# EAGLE schematic mainboard_test (EAGLE 9.6.2)
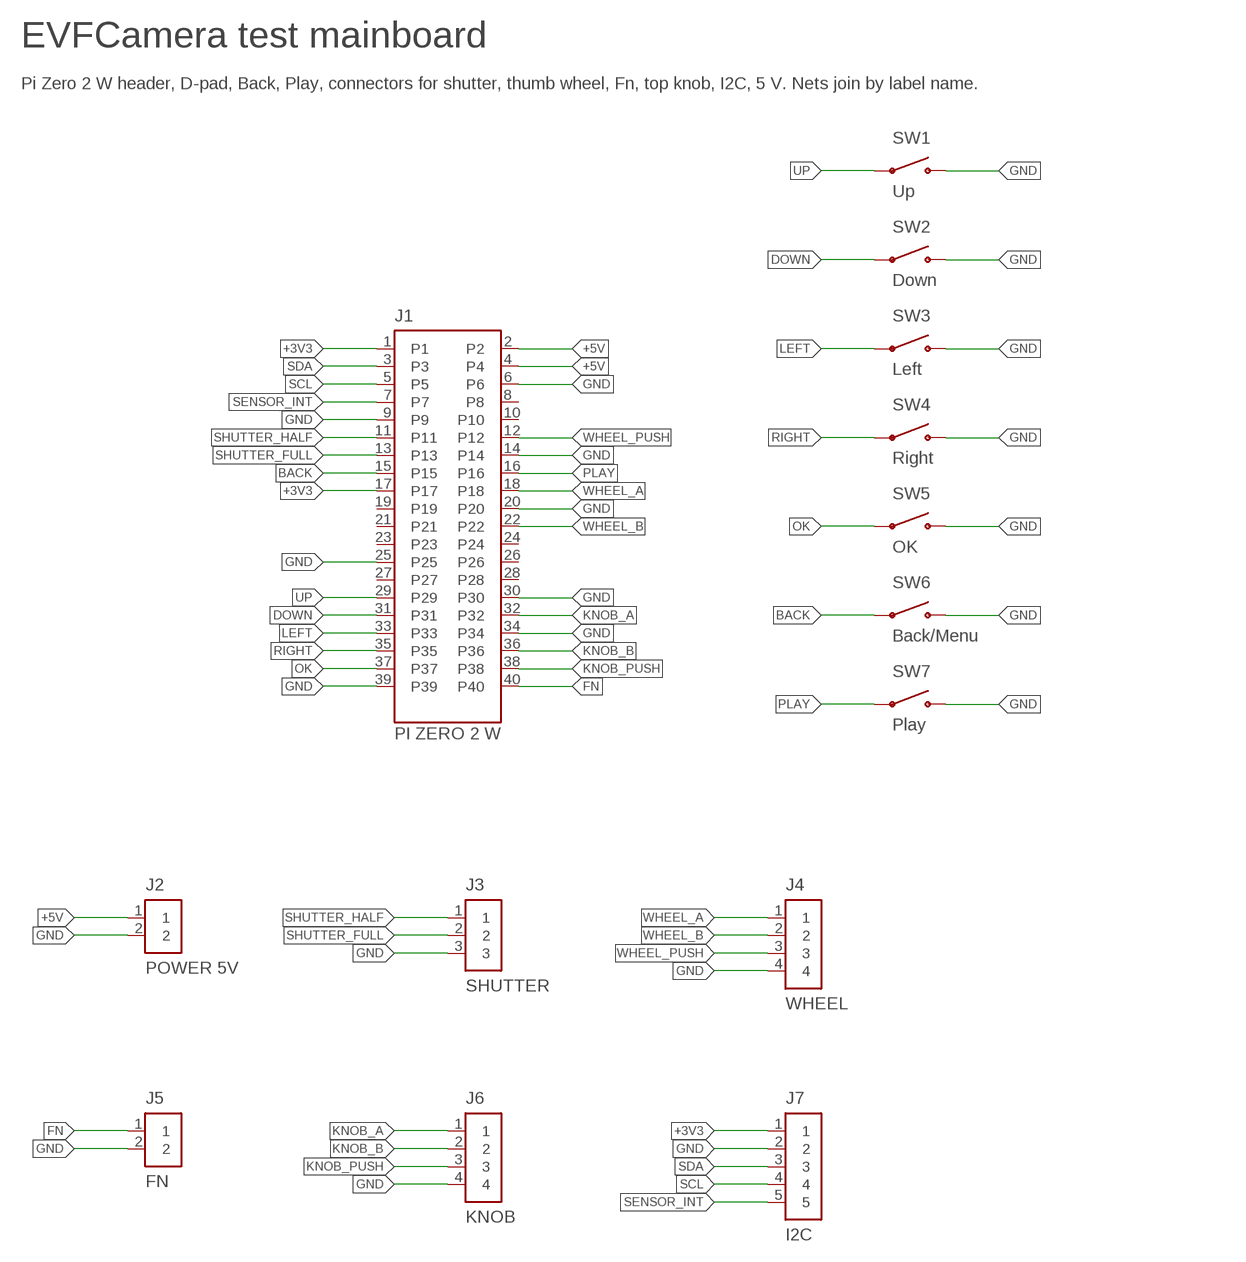
[diagram p0: schematic, sheet 1]

## Parts
J1  PI ZERO 2 W  PI_HEADER  [PI_HEADER_2X20]
J2  POWER 5V  HEADER_1X2  [HEADER_1X2]
J3  SHUTTER  HEADER_1X3  [HEADER_1X3]
J4  WHEEL  HEADER_1X4  [HEADER_1X4]
J5  FN  HEADER_1X2  [HEADER_1X2]
J6  KNOB  HEADER_1X4  [HEADER_1X4]
J7  I2C  HEADER_1X5  [HEADER_1X5]
SW1  Up  TACT_6X6  [TACT_6X6_THT]
SW2  Down  TACT_6X6  [TACT_6X6_THT]
SW3  Left  TACT_6X6  [TACT_6X6_THT]
SW4  Right  TACT_6X6  [TACT_6X6_THT]
SW5  OK  TACT_6X6  [TACT_6X6_THT]
SW6  Back/Menu  TACT_6X6  [TACT_6X6_THT]
SW7  Play  TACT_6X6  [TACT_6X6_THT]

## Nets
+3V3: J1.1 J1.17 J7.1
+5V: J1.2 J1.4 J2.1
BACK: J1.15 SW6.1(A)
DOWN: J1.31 SW2.1(A)
FN: J1.40 J5.1
GND: J1.6 J1.9 J1.14 J1.20 J1.25 J1.30 J1.34 J1.39 J2.2 J3.3 J4.4 J5.2 J6.4 J7.2 SW1.4(B) SW2.4(B) SW3.4(B) SW4.4(B) SW5.4(B) SW6.4(B) SW7.4(B)
KNOB_A: J1.32 J6.1
KNOB_B: J1.36 J6.2
KNOB_PUSH: J1.38 J6.3
LEFT: J1.33 SW3.1(A)
OK: J1.37 SW5.1(A)
PLAY: J1.16 SW7.1(A)
RIGHT: J1.35 SW4.1(A)
SCL: J1.5 J7.4
SDA: J1.3 J7.3
SENSOR_INT: J1.7 J7.5
SHUTTER_FULL: J1.13 J3.2
SHUTTER_HALF: J1.11 J3.1
UP: J1.29 SW1.1(A)
WHEEL_A: J1.18 J4.1
WHEEL_B: J1.22 J4.2
WHEEL_PUSH: J1.12 J4.3
Unconnected: J1.8 J1.10 J1.19 J1.21 J1.23 J1.24 J1.26 J1.27 J1.28

## Notes on the sheet
- EVFCamera test mainboard
- Pi Zero 2 W header, D-pad, Back, Play, connectors for shutter, thumb wheel, Fn, top knob, I2C, 5 V. Nets join by label name.

## Library data of the parts
J1 = evfcam:PI_HEADER: Raspberry Pi 40-pin header
J2 J5 = evfcam:HEADER_1X2: 1x2 pin header
J3 = evfcam:HEADER_1X3: 1x3 pin header
J4 J6 = evfcam:HEADER_1X4: 1x4 pin header
J7 = evfcam:HEADER_1X5: 1x5 pin header
SW1-SW7 = evfcam:TACT_6X6: 6x6 mm tact switch, diagonal pads